# Altium project GR_carte_action27.PrjPcb
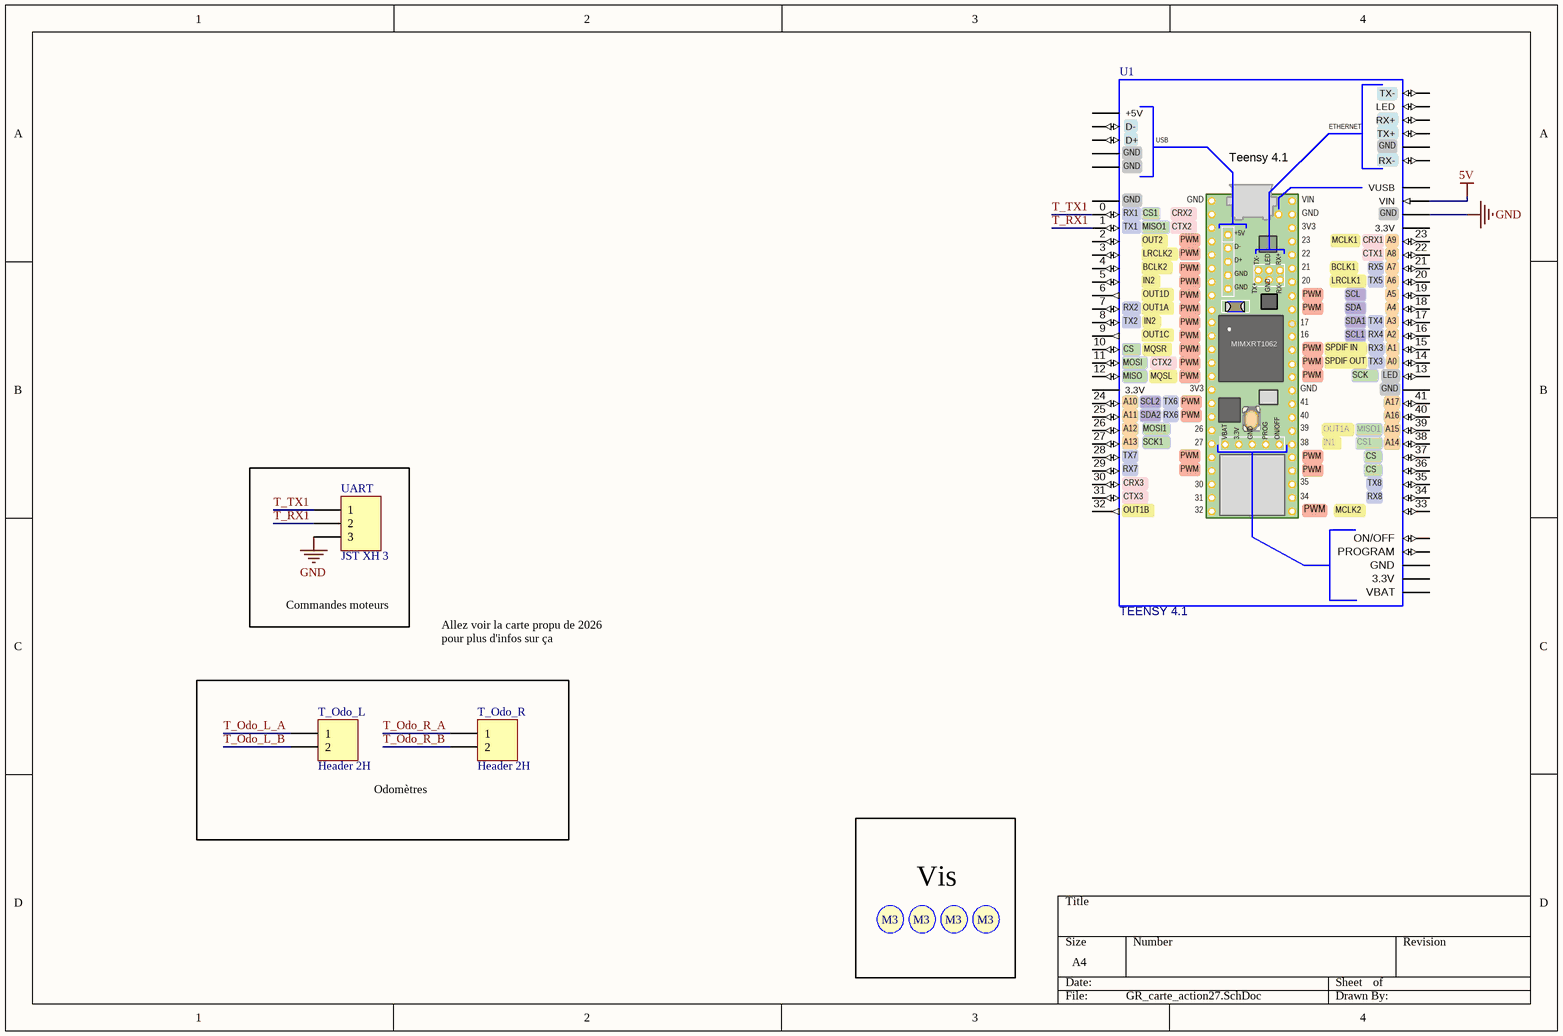
[diagram p0: GR_carte_action27.SchDoc]
1 sheet, 8 parts. Net scope: global (net labels, ports and power ports of the same name join across sheets).
Board file: GR_carte_action27.PcbDoc

## Sheet GR_carte_action27.SchDoc
size A4; SheetNumber: 1; SheetTotal: 1

### Parts
(Parts that share a designator on the sheet are numbered #1, #2 ... from top to bottom, then left to right.)
S?#1  Screw M3  [Screw M3]  (value not drawn)
S?#2  Screw M3  [Screw M3]  (value not drawn)
S?#3  Screw M3  [Screw M3]  (value not drawn)
S?#4  Screw M3  [Screw M3]  (value not drawn)
T_Odo_L  Header 2H  [S2B-XH-A]
T_Odo_R  Header 2H  [S2B-XH-A]
U1  value TEENSY 4.1  [Teensy_4.1]  (hidden comment: TEENSY_4.1)
UART  JST XH 3  [S3B-XH-A]

### Nets
5V: U1.VIN
GND: U1.GND3(GND) UART.3
T_Odo_L_A: T_Odo_L.1
T_Odo_L_B: T_Odo_L.2
T_Odo_R_A: T_Odo_R.1
T_Odo_R_B: T_Odo_R.2
T_RX1: U1.1(TX1) UART.2
T_TX1: U1.0(RX1) UART.1

Not connected (* = marked no-connect by the designer): U1 2(OUT2) 3(LRCLK2) 3.3V_1(3.3V) 3.3V_2(3.3V) 3.3V_3(3.3V) 4(BCLK2) 5(IN2) 5V(+5V) 6(OUT1D) 7(RX2) 8(TX2) 9(OUT1C) 10(CS1) 11(MOSI) 12(MISO) 13(SCK) 14(A0) 15(A1) 16(A2) 17(A3) 18(A4) 19(A5) 20(A6) 21(A7) 22(A8) 23(A9) 24(A10) 25(A11) 26(A12) 27(A13) 28(RX7) 29(TX7) 30(CRX3) 31(CTX3) 32(OUT1B) 33(MCLK2) 34(RX8) 35(TX8) 36(CS2) 37(CS3) 38(A14) 39(A15) 40(A16) 41(A17) D+ D- GND1(GND) GND2(GND) GND4(GND) GND5(GND) LED ON/OFF PROGRAM RX+ RX- TX+ TX- USB_GND1(USB_GND) USB_GND2(USB_GND) VBAT VUSB

### Notes on the sheet
- Commandes moteurs
- Allez voir la carte propu de 2026 pour plus d'infos sur ça
- Odomètres
- (near S?#3) Vis
- (in symbol Screw M3) M3
- (in symbol TEENSY_4.1) ETHERNET; USB; Teensy 4.1; CRX2; MISO1; CTX2; 3V3; PWM; MCLK1; CRX1; CTX1; BCLK1; RX5; LRCLK1; TX5; SCL; OUT1A; SDA; SDA1; TX4; SCL1; RX4; MIMXRT1062; CS; MQSR; SPDIF IN; RX3; SPDIF OUT; TX3; MQSL; SCL2; TX6; SDA2; RX6; MOSI1; PROG; SCK1; IN1

### Library data of the parts
T_Odo_L T_Odo_R = Header 2H: Header, 2-Pin, Right Angle; LatestRevisionDate: 17-Jul-2002; LatestRevisionNote: Re-released for DXP Platform.; Publisher: Altium Limited
U1 = TEENSY_4.1: RT1062 Teensy 4.1 w/ Headers RT1062 600 MHZ; Manufacturer: PJRC; Manufacturer_Part_Number: DEV-16996; ComponentLink1Description: pin_function_front; ComponentLink1URL: https://www.pjrc.com/teensy/card11a_rev4_web.pdf; ComponentLink2Description: pin_function_back; ComponentLink2URL: https://www.pjrc.com/teensy/card11b_rev4_web.pdf; ComponentLink3Description: Digikey; ComponentLink3URL: https://www.digikey.com/en/products/detail/sparkfun-electronics/16996/13158152; ComponentLink4Description: Datasheet; ComponentLink4URL: https://mm.digikey.com/Volume0/opasdata/d220001/medias/docus/2942/DEV-16996_Web.pdf
UART = Header 3H: Header, 3-Pin, Right Angle; LatestRevisionDate: 17-Jul-2002; LatestRevisionNote: Re-released for DXP Platform.; Publisher: Altium Limited